# Altium project RheoBoard_v2.PrjPcb (part 4 of 5)
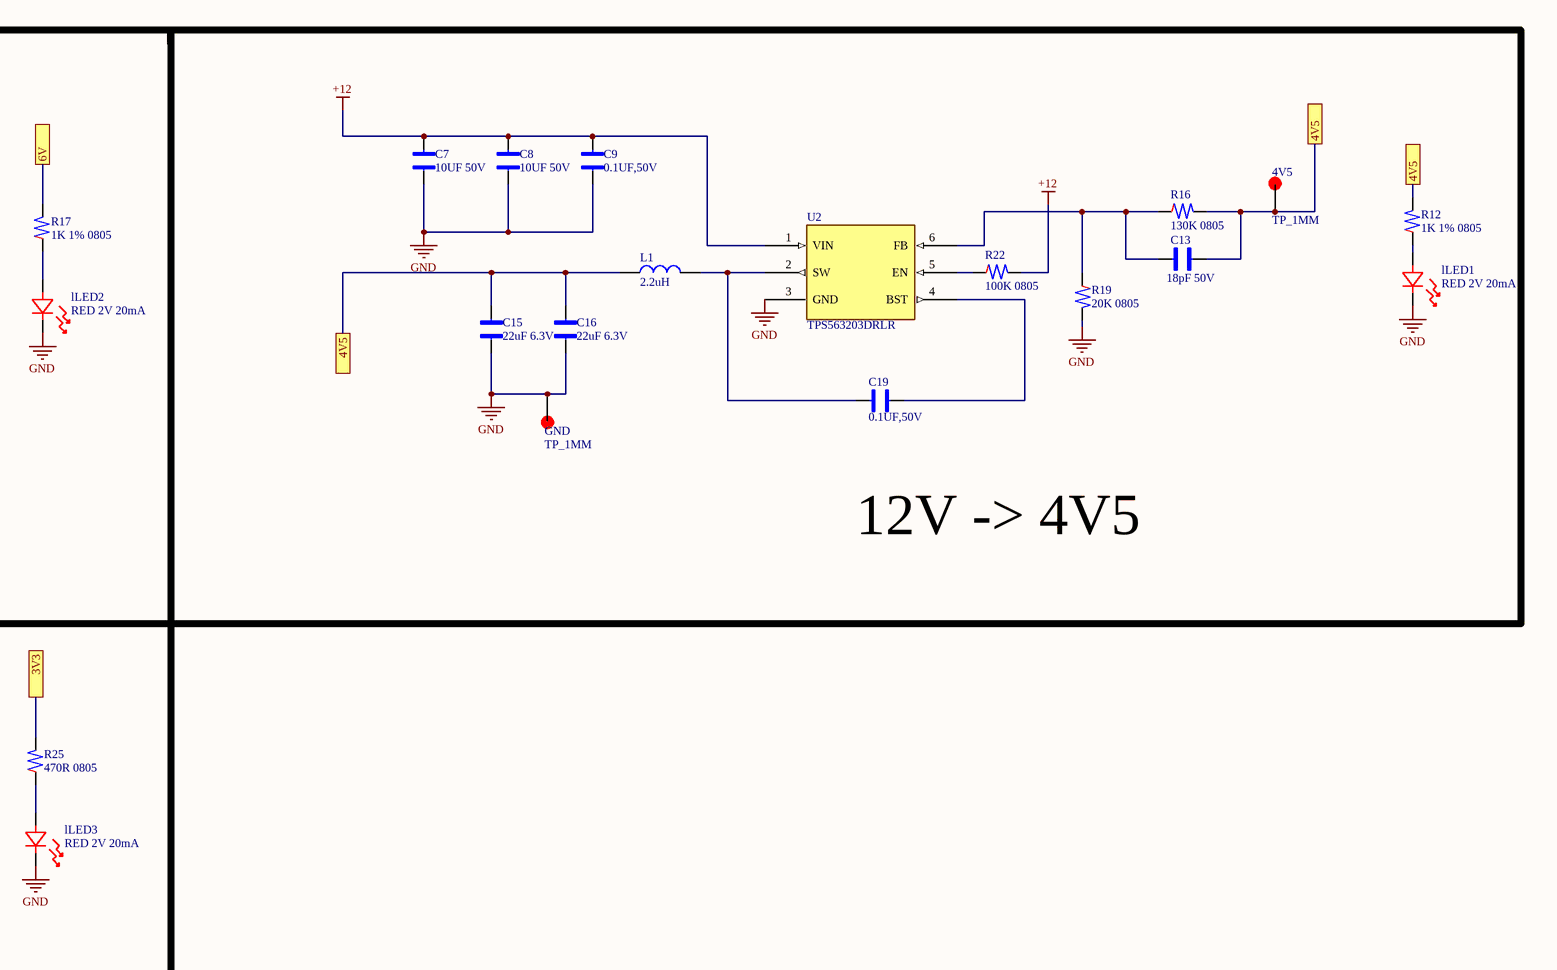
[diagram p13: POWER.SchDoc, right]

## Sheet POWER.SchDoc (continued)
### Library data of the parts
6V = TP_1MM
C7 C8 C10 C11 = CAP_CER, 0805, X5R, 10UF, 10%, 50V: CAP_CER,0805,X5R,10UF,10%,50V; Manufacturer: Nextgen; Manufacturer Part Number: 0805W106K500CC; LIB MADE BY: MR HOANG; Supplier 1: DigiKey Marketplace; Category: Ceramic Capacitors; Stock 1: 8000000; Pricing 1: 3000=1.1378 (USD); LINK: https://linhkien.cxtvn.com/1978-tu-106-10uf-0805-50v-10-10c.html; Supplier Part Number 1: 3372-0805W106K500CCTR-ND
C9 C12 C19-C22 = CAP_CER, 0805, X7R, 0.1UF, 5%, 50V: Ceramic Capacitor, Multilayer, Ceramic, 50V, 10% +Tol, 10% -Tol, X7R, 15% TC, 0.1uF, Surface Mount, 0805; Manufacturer: Nextgen; Manufacturer Part Number: 0805B104K500BD; Capacitance: 100nF; LIB MADE BY: MR HOANG; Supplier 1: DigiKey Marketplace; RoHS: Compliant; Category: Ceramic Capacitors; Stock 1: 24000; Pricing 1: 8000=0.0788 (USD); Dielectric Material: Ceramic; Export Control Classification Number (ECCN) Code: EAR99; Height: 850µm; Harmonized Tariff Schedule (HTS) Code: 8532.24.00.20; Length: 2mm; Max Operating Temperature: 125°C; Min Operating Temperature: -55°C; Mount: Surface Mount; Number of Terminals: 2; REACH SVHC: Yes; Voltage Rating (DC): 50V; Width: 1.25mm; ComponentLink1Description: New link; ComponentLink1URL: *; LINK: https://linhkien.cxtvn.com/1976-tu-khong-phan-cuc-0805.html; Supplier Part Number 1: 3372-0805B104K500BDTR-ND
C13 C14 = CAP_CER, 18PF 50V X8R 0805: Multilayer Ceramic Capacitors MLCC - SMD/SMT 50V 18pF X8R 0805 5%; Manufacturer: Yageo Group; Manufacturer Part Number: C0805C180J5HACTU; Temperature Coefficient: 30ppm/°C; LIB MADE BY: MR HOANG; Supplier 1: DigiKey; RoHS: Compliant; Category: Ceramic Capacitors; Stock 1: 17375; Pricing 1: 1=0.1, 10=0.054, 50=0.0372, 100=0.0321, 500=0.02342, 1000=0.02077 (USD); Capacitance: 18pF; Case/Package: 0805; China RoHS: Compliant; Country of Origin: Mexico; Dielectric: X8R; Dielectric Material: Ceramic; Export Control Classification Number (ECCN) Code: EAR99; Height: 780µm; Harmonized Tariff Schedule (HTS) Code: 8532.24.00.20; Introduction Date: 2017-10-02; Lead Free: Lead Free; Length: 2mm; Lifecycle Status: Production; Material: Ceramic; Max Operating Temperature: 150°C; Min Operating Temperature: -55°C; Mount: Surface Mount; Number of Terminals: 2; REACH SVHC: Yes; Voltage Rating: 50V; Voltage Rating (DC): 50V; Width: 1.25mm; ComponentLink1URL: https://datasheet.octopart.com:443/C0805C180J5HACTU-KEMET-datasheet-178087918.pdf?src-supplier=IHS; ComponentLink1Description: https://datasheet.octopart.com:443/C0805C180J5HACTU-KEMET-datasheet-178087918.pdf?src-supplier=IHS; ComponentLink2URL: https://datasheet.octopart.com:443/C0805C180J5HACTU-KEMET-datasheet-68331921.pdf?src-supplier=Upverter; ComponentLink2Description: https://datasheet.octopart.com:443/C0805C180J5HACTU-KEMET-datasheet-68331921.pdf?src-supplier=Upverter; ComponentLink3URL: https://datasheet.octopart.com:443/C0805C180J5HACTU-KEMET-datasheet-189885856.pdf?src-supplier=element14+APAC; ComponentLink3Description: https://datasheet.octopart.com:443/C0805C180J5HACTU-KEMET-datasheet-189885856.pdf?src-supplier=element14+APAC; ComponentLink4URL: https://datasheet.octopart.com/C0805C180J5HACTU-KEMET-datasheet-84169754.pdf; ComponentLink4Description: https://datasheet.octopart.com/C0805C180J5HACTU-KEMET-datasheet-84169754.pdf; Supplier Part Number 1: 399-C0805C180J5HACTUCT-ND; LINK: https://linhkien.cxtvn.com/2648-tu-180-18pf-0805-50v-5-20c.html
C15-C18 C25 C26 = CAP_CER 22UF 6.3V X6S 0603: 6.3V 22uF X6S ±20% 0603 Multilayer Ceramic Capacitors MLCC - SMD/SMT ROHS; Manufacturer: Murata; Manufacturer Part Number: GRM188C80J226ME15D; Manufacturer Lifecycle Status: IN PRODUCTION; Capacitance: 22µF; LIB MADE BY: MR HOANG; Supplier 1: DigiKey; RoHS: Compliant; Category: Ceramic Capacitors; Stock 1: 368335; Pricing 1: 1=0.18, 10=0.104, 50=0.0732, 100=0.0639, 500=0.04836, 1000=0.04357 (USD); Case/Package: 0603; Case Code (Imperial): 0603; Case Code (Metric): 1608; Country of Origin: Japan, Mainland China, Philippines, Singapore, Thailand; Dielectric: X6S; Dielectric Material: Ceramic; Export Control Classification Number (ECCN) Code: EAR99; Height: 800µm; Harmonized Tariff Schedule (HTS) Code: 8532.24.00.20; Introduction Date: 2013-11-20; Lead Free: Lead Free; Length: 1.6mm; Lifecycle Status: Production; Material: Ceramic; Max Operating Temperature: 105°C; Min Operating Temperature: -55°C; Mount: Surface Mount; Number of Terminals: 2; Packaging: Tape & Reel (TR); REACH SVHC: Yes; Schedule B: 8532240020, 8532240020|8532240020|8532240020|8532240020|8532240020|8532240020|8532240020|8532240020|8532240020|8532240020|8532240020|8532240020|8532240020|8532240020|8532240020|8532240020|8532240020|8532240020|8532240020|8532240020|8532240020|8532240020|8532240020|85; Termination: SMD/SMT; Thickness: 800µm; Tolerance: 20%; Voltage Rating: 6.3V; Voltage Rating (DC): 6.3V; Weight: 6.293594mg; Width: 800µm; ComponentLink1URL: https://datasheet.octopart.com:443/GRM188C80J226ME15D-Murata-datasheet-149523170.pdf?src-supplier=Newark; ComponentLink1Description: https://datasheet.octopart.com:443/GRM188C80J226ME15D-Murata-datasheet-149523170.pdf?src-supplier=Newark; ComponentLink2URL: https://datasheet.octopart.com:443/GRM188C80J226ME15D-Murata-datasheet-141274635.pdf?src-supplier=Geoflip; ComponentLink2Description: https://datasheet.octopart.com:443/GRM188C80J226ME15D-Murata-datasheet-141274635.pdf?src-supplier=Geoflip; ComponentLink3URL: https://datasheet.octopart.com:443/GRM188C80J226ME15D-Murata-datasheet-165579666.pdf?src-supplier=TME; ComponentLink3Description: https://datasheet.octopart.com:443/GRM188C80J226ME15D-Murata-datasheet-165579666.pdf?src-supplier=TME; ComponentLink4URL: https://datasheet.octopart.com:443/GRM188C80J226ME15D-Murata-datasheet-140703315.pdf?src-supplier=Ciiva; ComponentLink4Description: https://datasheet.octopart.com:443/GRM188C80J226ME15D-Murata-datasheet-140703315.pdf?src-supplier=Ciiva; ComponentLink5URL: https://datasheet.octopart.com:443/GRM188C80J226ME15D-Murata-datasheet-138742657.pdf?src-supplier=Ciiva; ComponentLink5Description: https://datasheet.octopart.com:443/GRM188C80J226ME15D-Murata-datasheet-138742657.pdf?src-supplier=Ciiva; ComponentLink6URL: https://datasheet.octopart.com:443/GRM188C80J226ME15D-Murata-datasheet-22122223.pdf?src-supplier=Future+Electronics; ComponentLink6Description: https://datasheet.octopart.com:443/GRM188C80J226ME15D-Murata-datasheet-22122223.pdf?src-supplier=Future+Electronics; ComponentLink7URL: https://datasheet.octopart.com/GRM188C80J226ME15D-Murata-datasheet-12515295.pdf; ComponentLink7Description: https://datasheet.octopart.com/GRM188C80J226ME15D-Murata-datasheet-12515295.pdf; ComponentLink8URL: https://datasheet.octopart.com/GRM188C80J226ME15D-Murata-datasheet-12510076.pdf; ComponentLink8Description: https://datasheet.octopart.com/GRM188C80J226ME15D-Murata-datasheet-12510076.pdf; ComponentLink9URL: https://datasheet.octopart.com/GRM188C80J226ME15D-Murata-datasheet-11978611.pdf; ComponentLink9Description: https://datasheet.octopart.com/GRM188C80J226ME15D-Murata-datasheet-11978611.pdf; ComponentLink10URL: https://datasheet.octopart.com/GRM188C80J226ME15D-Murata-datasheet-10025737.pdf; ComponentLink10Description: https://datasheet.octopart.com/GRM188C80J226ME15D-Murata-datasheet-10025737.pdf; ComponentLink11URL: https://datasheet.octopart.com/GRM188C80J226ME15D-Murata-datasheet-8819587.pdf; ComponentLink11Description: https://datasheet.octopart.com/GRM188C80J226ME15D-Murata-datasheet-8819587.pdf; ComponentLink12URL: https://datasheet.octopart.com:443/GRM188C80J226ME15D-Murata-datasheet-150839322.pdf?src-supplier=Arrow.cn; ComponentLink12Description: https://datasheet.octopart.com:443/GRM188C80J226ME15D-Murata-datasheet-150839322.pdf?src-supplier=Arrow.cn; ComponentLink13URL: http://sigma.octopart.com:80/reach_statement/Murata-company-16.pdf?src-supplier=Compliance+Statements; ComponentLink13Description: http://sigma.octopart.com:80/reach_statement/Murata-company-16.pdf?src-supplier=Compliance+Statements; Supplier Part Number 1: 490-10471-1-ND; LINK: https://linhkien.cxtvn.com/3837-tu-226-22uf-0603-63v-20c.html
C23 C24 = CAP_CER, 0805, X5R, 10UF, 10%, 25V: Cap SMD, 0805, X5R, 10UF, 10%, 25V; Manufacturer: Nextgen; Manufacturer Part Number: 0805W106K250CC; LIB MADE BY: MR HOANG; Supplier 1: DigiKey Marketplace; Category: Ceramic Capacitors; Stock 1: 18000; Pricing 1: 6000=0.1738 (USD); Supplier Part Number 1: 3372-0805W106K250CCTR-ND; LINK: https://linhkien.cxtvn.com/5144-tu-10uf-0805-25v-10-10c.html
D8 = MOSFET P-CH 20V 4A SOT23-3: P-ch Mosfet 20V 4A 39MΩ@4A, 4.5V 9.1NC@4.5V 294PF@10V SOT-23-3 SMD 2.9MM × 1.3MM × 1.03MM; Manufacturer: Diodes Inc.; Manufacturer Part Number: DMG3415U-7; Drain to Source Breakdown Voltage: -20V; Drain to Source Resistance: 42.5mΩ; Element Configuration: Single; Fall Time: 393ns; Gate to Source Voltage (Vgs): 8V; Input Capacitance: 294pF; Max Junction Temperature (Tj): 150°C; Max Power Dissipation: 900mW; Nominal Vgs: -550mV; Number of Channels: 1; Rds On Max: 39mΩ; Rise Time: 117ns; Turn-Off Delay Time: 795ns; Turn-On Delay Time: 71ns; LIB MADE BY: MR HOANG; Supplier 1: DigiKey; RoHS: Compliant; Category: MOSFETs; Stock 1: 74827; Pricing 1: 1=0.52, 10=0.318, 25=0.264, 50=0.23, 100=0.2012 (USD); Case/Package: SOT-23; China RoHS: Compliant; Contact Plating: Tin; Continuous Drain Current (ID): 4A; Drain to Source Voltage (Vdss): -20V; Height: 1.1mm; Lead Free: Lead Free; Length: 2.9mm; Lifecycle Status: NRND; Max Operating Temperature: 150°C; Min Breakdown Voltage: 20V; Min Operating Temperature: -55°C; Mount: Surface Mount; Number of Elements: 1; Number of Pins: 3; Number of Terminals: 3; Packaging: Cut Tape; Power Dissipation: 900mW; Radiation Hardening: No; REACH SVHC: Yes; Resistance: 42.5mΩ; Schedule B: 8541210080, 8541210080|8541210080|8541210080|8541210080|8541210080|8541210080|8541210080|8541210080|8541210080|8541210080|8541210080|8541210080|8541210080|8541210080|8541210080|8541210080|8541210080|8541210080|8541210080|8541210080|8541210080|8541210080|8541210080|85; Threshold Voltage: -550mV; Weight: 7.994566mg; Width: 1.3mm; ComponentLink1URL: https://datasheet.octopart.com:443/DMG3415U-7-Diodes-Inc.-datasheet-180552899.pdf?src-supplier=IHS; ComponentLink1Description: https://datasheet.octopart.com:443/DMG3415U-7-Diodes-Inc.-datasheet-180552899.pdf?src-supplier=IHS; ComponentLink2URL: https://datasheet.octopart.com:443/DMG3415U-7-Diodes-Inc.-datasheet-41567333.pdf?src-supplier=Newark; ComponentLink2Description: https://datasheet.octopart.com:443/DMG3415U-7-Diodes-Inc.-datasheet-41567333.pdf?src-supplier=Newark; ComponentLink3URL: https://datasheet.octopart.com:443/DMG3415U-7-Diodes-Inc.-datasheet-12530588.pdf?src-supplier=Newark; ComponentLink3Description: https://datasheet.octopart.com:443/DMG3415U-7-Diodes-Inc.-datasheet-12530588.pdf?src-supplier=Newark; ComponentLink4URL: https://datasheet.octopart.com:443/DMG3415U-7-Diodes-Inc.-datasheet-10027536.pdf?src-supplier=Newark; ComponentLink4Description: https://datasheet.octopart.com:443/DMG3415U-7-Diodes-Inc.-datasheet-10027536.pdf?src-supplier=Newark; ComponentLink5URL: https://sigma.octopart.com:443/138706058/technical_drawing/Diodes-Inc.-DMG3415U-7.pdf?src-supplier=Upverter; ComponentLink5Description: https://sigma.octopart.com:443/138706058/technical_drawing/Diodes-Inc.-DMG3415U-7.pdf?src-supplier=Upverter; ComponentLink6URL: https://datasheet.octopart.com:443/DMG3415U-7-Diodes-Inc.-datasheet-14060167.pdf?src-supplier=iiiC; ComponentLink6Description: https://datasheet.octopart.com:443/DMG3415U-7-Diodes-Inc.-datasheet-14060167.pdf?src-supplier=iiiC; ComponentLink7URL: https://datasheet.octopart.com:443/DMG3415U-7-Diodes-Inc.-datasheet-11766085.pdf?src-supplier=Future+Electronics; ComponentLink7Description: https://datasheet.octopart.com:443/DMG3415U-7-Diodes-Inc.-datasheet-11766085.pdf?src-supplier=Future+Electronics; ComponentLink8URL: http://sigma.octopart.com:80/15540767/rohs_statement/Diodes-Inc.-DMG3415U-7.pdf?src-supplier=Compliance+Statements; ComponentLink8Description: http://sigma.octopart.com:80/15540767/rohs_statement/Diodes-Inc.-DMG3415U-7.pdf?src-supplier=Compliance+Statements; Supplier Part Number 1: DMG3415UDIDKR-ND; LINK: https://linhkien.cxtvn.com/2362-dmg3415-mosfet-p-ch-20v-4a-sot23-3-5c.html
D9 = DIODE ZENER 5.1V 500MW SOD123F: BZT52C5V1 Series 500 mW 5.1 V 10 mA Surface Mount Zener Diode - SOD-123; Manufacturer: Diodes Inc.; Manufacturer Part Number: BZT52C5V1-7-F; Current: 1A; Element Configuration: Single; Forward Current: 10mA; Forward Voltage: 900mV; Impedance: 60Ω; Max Junction Temperature (Tj): 150°C; Max Power Dissipation: 370mW; Max Reverse Leakage Current: 2µA; Number of Elements: 1; Output Current: 50mA; Polarity: Unidirectional; Power Rating: 500mW; Reference Voltage: 5.1V; Reverse Standoff Voltage: 2V; Test Current: 5mA; Tolerance: 6%; Voltage Tolerance: 5.88%; LIB MADE BY: MR HOANG; Supplier 1: DigiKey; RoHS: Compliant; Category: Zener Diodes; Pricing 1: 1=0.21, 10=0.128, 25=0.1052, 50=0.091, 100=0.079 (USD); China RoHS: Compliant; Composition: Zener; Country of Origin: Mainland China, Taiwan; Export Control Classification Number (ECCN) Code: EAR99; Height: 1.45mm; Harmonized Tariff Schedule (HTS) Code: 8541.10.00.50; Introduction Date: 2002-09-04; Lead Free: Lead Free; Length: 2.85mm; Lifecycle Status: Production; Max Operating Temperature: 150°C; Min Operating Temperature: -65°C; Mount: Surface Mount; Number of Pins: 2; Number of Terminals: 2; Packaging: Cut Tape; Peak Reverse Current: 2µA; Power Dissipation: 370mW; Radiation Hardening: No; REACH SVHC: Yes; Schedule B: 8541100050, 8541100050|8541100050|8541100050|8541100050|8541100050|8541100050|8541100050|8541100050|8541100050|8541100050|8541100050|8541100050|8541100050|8541100050|8541100050|8541100050|8541100050|8541100050|8541100050|8541100050|8541100050|8541100050|8541100050|85; Termination: SMD/SMT; Voltage Rating (DC): 5.1V; Weight: 10.007382mg; Width: 1.7mm; Working Voltage: 5.1V; Zener Current: 5mA; Zener Voltage: 5.1V; ComponentLink1URL: https://datasheet.octopart.com:443/BZT52C5V1-7-F-Diodes-Inc.-datasheet-101585693.pdf?src-supplier=IHS; ComponentLink1Description: https://datasheet.octopart.com:443/BZT52C5V1-7-F-Diodes-Inc.-datasheet-101585693.pdf?src-supplier=IHS; ComponentLink2URL: https://sigma.octopart.com:443/138895985/technical_drawing/Diodes-Inc.-BZT52C5V1-7-F.pdf?src-supplier=Diodes+Inc+SCT; ComponentLink2Description: https://sigma.octopart.com:443/138895985/technical_drawing/Diodes-Inc.-BZT52C5V1-7-F.pdf?src-supplier=Diodes+Inc+SCT; ComponentLink3URL: https://datasheet.octopart.com:443/BZT52C5V1-7-F-Diodes-Inc.-datasheet-12513818.pdf?src-supplier=Newark; ComponentLink3Description: https://datasheet.octopart.com:443/BZT52C5V1-7-F-Diodes-Inc.-datasheet-12513818.pdf?src-supplier=Newark; ComponentLink4URL: https://datasheet.octopart.com:443/BZT52C5V1-7-F-Diodes-Inc.-datasheet-10839781.pdf?src-supplier=element14+APAC; ComponentLink4Description: https://datasheet.octopart.com:443/BZT52C5V1-7-F-Diodes-Inc.-datasheet-10839781.pdf?src-supplier=element14+APAC; ComponentLink5URL: https://datasheet.octopart.com:443/BZT52C5V1-7-F-Diodes-Inc.-datasheet-10941054.pdf?src-supplier=element14+APAC; ComponentLink5Description: https://datasheet.octopart.com:443/BZT52C5V1-7-F-Diodes-Inc.-datasheet-10941054.pdf?src-supplier=element14+APAC; ComponentLink6URL: https://datasheet.octopart.com:443/BZT52C5V1-7-F-Diodes-Inc.-datasheet-10405015.pdf?src-supplier=element14+APAC; ComponentLink6Description: https://datasheet.octopart.com:443/BZT52C5V1-7-F-Diodes-Inc.-datasheet-10405015.pdf?src-supplier=element14+APAC; ComponentLink7URL: https://datasheet.octopart.com:443/BZT52C5V1-7-F-Diodes-Inc.-datasheet-5318325.pdf?src-supplier=element14+APAC; ComponentLink7Description: https://datasheet.octopart.com:443/BZT52C5V1-7-F-Diodes-Inc.-datasheet-5318325.pdf?src-supplier=element14+APAC; ComponentLink8URL: https://datasheet.octopart.com:443/BZT52C5V1-7-F-Diodes-Inc.-datasheet-14050928.pdf?src-supplier=iiiC; ComponentLink8Description: https://datasheet.octopart.com:443/BZT52C5V1-7-F-Diodes-Inc.-datasheet-14050928.pdf?src-supplier=iiiC; ComponentLink9URL: https://datasheet.octopart.com:443/BZT52C5V1-7-F-Diodes-Inc.-datasheet-7278440.pdf?src-supplier=Jameco+(USA); ComponentLink9Description: https://datasheet.octopart.com:443/BZT52C5V1-7-F-Diodes-Inc.-datasheet-7278440.pdf?src-supplier=Jameco+(USA); ComponentLink10URL: https://datasheet.octopart.com:443/BZT52C5V1-7-F-Diodes-Inc.-datasheet-1309.pdf?src-supplier=Mouser; ComponentLink10Description: https://datasheet.octopart.com:443/BZT52C5V1-7-F-Diodes-Inc.-datasheet-1309.pdf?src-supplier=Mouser; ComponentLink11URL: https://datasheet.octopart.com:443/BZT52C5V1-7-F-Diodes-Inc.-datasheet-593.pdf?src-supplier=DigiKey; ComponentLink11Description: https://datasheet.octopart.com:443/BZT52C5V1-7-F-Diodes-Inc.-datasheet-593.pdf?src-supplier=DigiKey; ComponentLink12URL: http://sigma.octopart.com:80/15616906/materials_sheet/Diodes-Inc.-BZT52C5V1-7-F.pdf?src-supplier=Compliance+Statements; ComponentLink12Description: http://sigma.octopart.com:80/15616906/materials_sheet/Diodes-Inc.-BZT52C5V1-7-F.pdf?src-supplier=Compliance+Statements; Supplier Part Number 1: BZT52C5V1-FDICT-ND; ComponentLink13Description: New link; ComponentLink13URL: *; LINK: https://linhkien.cxtvn.com/2446-bzt52c5v1-diode-zener-51v-500mw-sod123-10c.html
J6 = CONN PWR JACK 2.1X5.5MM SOLDER: DC Power Jack Connector WR-DC, Male, Right Angled, THT, 5 A, 24 V; Manufacturer: Wurth Elektronik; Manufacturer Lifecycle Status: ACTIVE; Current Rating: 5A; Insulation Resistance: 100MΩ; Number of Contacts: 3; Operating Supply Voltage: 24V; Shielding: Unshielded; YEOL: 1 = Estimated lifetime > 10 years; LIB MADE BY: MR HOANG; Supplier 1: DigiKey; Manufacturer Part Number: 694106301002; RoHS: Compliant; Category: Power Connectors; Stock 1: 29038; Pricing 1: 1=0.97, 10=0.922, 50=0.817, 100=0.76, 500=0.6555, 1000=0.59885 (USD); Color: Black; Connector Type: Power; Contact Gender: Female; Contact Material: Gold, Tin; Contact Plating: Tin; Flammability Rating: UL94 V-0; Gender: Male; Height: 11mm; Housing Material: Polyamide; Lifecycle Status: Production; Max Operating Temperature: 85°C; Min Operating Temperature: -40°C; Mount: Through Hole; Packaging: Bulk; REACH SVHC: Unknown; Termination: Through Hole; Voltage Rating: 24V; ComponentLink1URL: https://datasheet.octopart.com:443/694106301002-W%C3%BCrth-Elektronik-datasheet-111088219.pdf?src-supplier=Newark; ComponentLink1Description: https://datasheet.octopart.com:443/694106301002-W%C3%BCrth-Elektronik-datasheet-111088219.pdf?src-supplier=Newark; ComponentLink2URL: https://datasheet.octopart.com:443/694106301002-W%C3%BCrth-Elektronik-datasheet-38737356.pdf?src-supplier=Farnell; ComponentLink2Description: https://datasheet.octopart.com:443/694106301002-W%C3%BCrth-Elektronik-datasheet-38737356.pdf?src-supplier=Farnell; ComponentLink3URL: https://datasheet.octopart.com:443/694106301002-W%C3%BCrth-Elektronik-datasheet-66582004.pdf?src-supplier=Farnell; ComponentLink3Description: https://datasheet.octopart.com:443/694106301002-W%C3%BCrth-Elektronik-datasheet-66582004.pdf?src-supplier=Farnell; Supplier Part Number 1: 732-5930-ND; ComponentLink4Description: New link; ComponentLink4URL: *; LINK: https://www.lcsc.com/product-detail/C5184829.html?s_z=n_q_694106301002&spm=wm.fly.bg.0.xh&lcsc_vid=FlMMUgJST1FcAwECRwALVlxQQAdaX1xfRFUPAlJUQFExVlNeTlBWV1NVQllaUjsOAxUeFF5JWBYZEEoKFBINSQcJGk4NBhADEA4cHktXRlhXSQwSGg0%3D
L1 L2 = FIXED IND 2.2UH 3A 45 MOHM SMD: Inductor Power Shielded Wirewound 2.2uH 20% 100KHz Ferrite 3.1A 0.045Ohm DCR 1515 T/R; Manufacturer: Vishay; Manufacturer Part Number: IFSC1515AHER2R2M01; Current Rating: 3A; DC Resistance (DCR): 45mΩ; Inductance: 2.2µH; Max Current Rating: 2.8A; Number of Circuits: 1; Resistance: 35mΩ; LIB MADE BY: MR HOANG; Supplier 1: DigiKey; RoHS: Compliant; Category: Fixed Inductors; Stock 1: 112441; Pricing 1: 1=0.43, 10=0.35, 100=0.2878, 1000=0.23664 (USD); Case/Package: 1515; Composition: Wirewound; Contact Plating: Tin; Core Material: Ferrite; Country of Origin: Mainland China; Depth: 4mm; Export Control Classification Number (ECCN) Code: EAR99; Height: 1.8mm; Height - Seated (Max): 1.905mm; Harmonized Tariff Schedule (HTS) Code: 8504.50.80.00; Inductance Tolerance: 20%; Introduction Date: 2011-04-11; Lead Free: Lead Free; Length: 4mm; Lifecycle Status: Production; Max DC Current: 3A; Max Operating Temperature: 125°C; Military Standard: Not; Min Operating Temperature: -55°C; Mount: Surface Mount; Number of Pins: 2; Number of Terminals: 2; REACH SVHC: Yes; RMS Current (Irms): 3.1A; Saturation Current: 2.8A; Schedule B: 8504500000, 8504500000|8504500000|8504500000|8504500000|8504500000; Series Resistance: 45mΩ; Shielding: Shielded; Termination: SMD/SMT; Test Frequency: 100kHz; Tolerance: 20%; Width: 4mm; ComponentLink1URL: https://datasheet.octopart.com:443/IFSC1515AHER2R2M01-Vishay-datasheet-136687317.pdf?src-supplier=Newark; ComponentLink1Description: https://datasheet.octopart.com:443/IFSC1515AHER2R2M01-Vishay-datasheet-136687317.pdf?src-supplier=Newark; ComponentLink2URL: https://datasheet.octopart.com:443/IFSC1515AHER2R2M01-Vishay-datasheet-13160403.pdf?src-supplier=Newark; ComponentLink2Description: https://datasheet.octopart.com:443/IFSC1515AHER2R2M01-Vishay-datasheet-13160403.pdf?src-supplier=Newark; ComponentLink3URL: https://datasheet.octopart.com:443/IFSC1515AHER2R2M01-Vishay-datasheet-13060574.pdf?src-supplier=Newark; ComponentLink3Description: https://datasheet.octopart.com:443/IFSC1515AHER2R2M01-Vishay-datasheet-13060574.pdf?src-supplier=Newark; ComponentLink4URL: https://datasheet.octopart.com:443/IFSC1515AHER2R2M01-Vishay-datasheet-41303275.pdf?src-supplier=Newark; ComponentLink4Description: https://datasheet.octopart.com:443/IFSC1515AHER2R2M01-Vishay-datasheet-41303275.pdf?src-supplier=Newark; ComponentLink5URL: https://datasheet.octopart.com:443/IFSC1515AHER2R2M01-Vishay-datasheet-79543287.pdf?src-supplier=Upverter; ComponentLink5Description: https://datasheet.octopart.com:443/IFSC1515AHER2R2M01-Vishay-datasheet-79543287.pdf?src-supplier=Upverter; ComponentLink6URL: https://datasheet.octopart.com:443/IFSC1515AHER2R2M01-Vishay-datasheet-193387337.pdf?src-supplier=JRH+Electronics; ComponentLink6Description: https://datasheet.octopart.com:443/IFSC1515AHER2R2M01-Vishay-datasheet-193387337.pdf?src-supplier=JRH+Electronics; ComponentLink7URL: https://datasheet.octopart.com:443/IFSC1515AHER2R2M01-Vishay-datasheet-66100361.pdf?src-supplier=Farnell; ComponentLink7Description: https://datasheet.octopart.com:443/IFSC1515AHER2R2M01-Vishay-datasheet-66100361.pdf?src-supplier=Farnell; ComponentLink8URL: https://datasheet.octopart.com:443/IFSC1515AHER2R2M01-Vishay-datasheet-17360805.pdf?src-supplier=Farnell; ComponentLink8Description: https://datasheet.octopart.com:443/IFSC1515AHER2R2M01-Vishay-datasheet-17360805.pdf?src-supplier=Farnell; ComponentLink9URL: https://datasheet.octopart.com:443/IFSC1515AHER2R2M01-Vishay-datasheet-41195463.pdf?src-supplier=Farnell; ComponentLink9Description: https://datasheet.octopart.com:443/IFSC1515AHER2R2M01-Vishay-datasheet-41195463.pdf?src-supplier=Farnell; ComponentLink10URL: https://datasheet.octopart.com:443/IFSC1515AHER2R2M01-Vishay-datasheet-62318043.pdf?src-supplier=element14+APAC; ComponentLink10Description: https://datasheet.octopart.com:443/IFSC1515AHER2R2M01-Vishay-datasheet-62318043.pdf?src-supplier=element14+APAC; ComponentLink11URL: https://datasheet.octopart.com:443/IFSC1515AHER2R2M01-Vishay-Dale-datasheet-41169526.pdf?src-supplier=element14+APAC; ComponentLink11Description: https://datasheet.octopart.com:443/IFSC1515AHER2R2M01-Vishay-Dale-datasheet-41169526.pdf?src-supplier=element14+APAC; ComponentLink12URL: http://sigma.octopart.com:80/rohs_statement/Vishay-company-15.pdf?src-supplier=Compliance+Statements; ComponentLink12Description: http://sigma.octopart.com:80/rohs_statement/Vishay-company-15.pdf?src-supplier=Compliance+Statements; Supplier Part Number 1: 541-1404-6-ND; LINK: https://linhkien.cxtvn.com/10174-cuon-cam-22uh-cd127-3a-12x12x7mm.html
L3 = FIXED IND 4.7UH 6.3A 33 MOHM SMD: FIXED IND 4.7UH 6.3A 33MOHM SMD / 4.7 µH Shielded Molded Inductor 6.3 A 33mOhm Max Nonstandard; Manufacturer: Sumida; Manufacturer Part Number: 0630CDMCCDS-4R7MC; Core Material: Metal; DC Resistance (DCR): 33mΩ; Inductance: 4.7µH; Number of Circuits: 1; Saturation Current: 6.8A; Test Frequency: 100kHz; Tolerance: 20%; Supplier 1: DigiKey; RoHS: Compliant; Category: Fixed Inductors; Stock 1: 7042; Pricing 1: 1=0.75, 10=0.617, 100=0.5073 (USD); Case/Package: 2826; Current Rating: 6.3A; Export Control Classification Number (ECCN) Code: EAR99; Height: 2.8mm; Height - Seated (Max): 2.9972mm; Harmonized Tariff Schedule (HTS) Code: 8504.50.80.00; Introduction Date: 2015-07-17; Length: 7mm; Lifecycle Status: Production; Max Current Rating: 6.3A; Max DC Current: 6.3A; Max Operating Temperature: 125°C; Min Operating Temperature: -55°C; Mount: Surface Mount; Number of Terminals: 2; Shielding: Shielded; Width: 6.6mm; ComponentLink1URL: https://datasheet.octopart.com:443/0630CDMCCDS-4R7MC-Sumida-datasheet-181250631.pdf?src-supplier=IHS; ComponentLink1Description: https://datasheet.octopart.com:443/0630CDMCCDS-4R7MC-Sumida-datasheet-181250631.pdf?src-supplier=IHS; ComponentLink2URL: https://datasheet.octopart.com:443/0630CDMCCDS-4R7MC-Sumida-datasheet-111957342.pdf?src-supplier=Future+Electronics; ComponentLink2Description: https://datasheet.octopart.com:443/0630CDMCCDS-4R7MC-Sumida-datasheet-111957342.pdf?src-supplier=Future+Electronics; Supplier Part Number 1: 308-2466-1-ND
lLED1-lLED3 = LED RED DIFFUSED 0805 SMD: Red 633nm LED Indication - Discrete 2V 0805 (2012 Metric); Manufacturer: Osram; Manufacturer Part Number: LS R976-NR-1-0-20-R18; LIB MADE BY: MR HOANG; Supplier 1: DigiKey; Category: LEDs; Stock 1: 254416; Pricing 1: 1=0.15, 10=0.102, 100=0.0704, 500=0.05582, 1000=0.05095, 2000=0.04679 (USD); Schedule B: 8541402000, 8541402000|8541402000, 8541402000|8541402000|8541402000, 8541402000|8541402000|8541402000|8541402000; Supplier Part Number 1: 475-LSR976-NR-1CT-ND; Link: https://linhkien.cxtvn.com/10106-17-21surcs530-a3tr8-led-red-0805-624nm-10c.html
R12 R17 = RES_SMD 1K 1% 1/8W 0805: Yageo RC0805FR-071KL SMD Resistor 0603 1k Ohm ±1% Thick Film; Manufacturer: Yageo Group; Max Power Dissipation: 125mW; Resistance: 1kΩ; Temperature Coefficient: 100ppm/°C; Voltage Rating: 150V; LIBRARY MADE BY: Mr. HOANG; Supplier 1: element14 APAC; Manufacturer Part Number: RC0805FR-071KL; RoHS: Compliant; Category: Chip SMD Resistors; Stock 1: 210000; Pricing 1: 5000=0.012, 25000=0.010, 50000=50000 (USD); Case/Package: 0805; Case Code (Imperial): 0805; China RoHS: Non-Compliant; Composition: Thick Film; Country of Origin: Mainland China, Taiwan; Depth: 1.25mm; Export Control Classification Number (ECCN) Code: EAR99; Features: Moisture Resistant; Height: 500µm; Harmonized Tariff Schedule (HTS) Code: 8533.21.00.30; Introduction Date: 2004-09-22; Lead Free: Lead Free; Length: 2mm; Lifecycle Status: Production; Max Operating Temperature: 155°C; Military Standard: Not; Min Operating Temperature: -55°C; Mount: Surface Mount; Number of Pins: 2; Number of Terminals: 2; Number of Terminations: 2; Packaging: Tape & Reel; Power Dissipation: 125mW; Power Rating: 125mW; REACH SVHC: Yes; Schedule B: 8533210045, 8533210045|8533210045, 8533210045|8533210045|8533210045, 8533210045|8533210045|8533210045|8533210045; Termination: SMD/SMT; Tolerance: 1%; Voltage Rating (AC): 150V; Voltage Rating (DC): 150V; Width: 1.25mm; Working Voltage: 150V; ComponentLink1URL: https://datasheet.octopart.com:443/RC0805FR-071KL-Yageo-datasheet-175887523.pdf?src-supplier=IHS; ComponentLink1Description: https://datasheet.octopart.com:443/RC0805FR-071KL-Yageo-datasheet-175887523.pdf?src-supplier=IHS; ComponentLink2URL: https://datasheet.octopart.com:443/RC0805FR-071KL-Yageo-datasheet-103092701.pdf?src-supplier=Upverter; ComponentLink2Description: https://datasheet.octopart.com:443/RC0805FR-071KL-Yageo-datasheet-103092701.pdf?src-supplier=Upverter; ComponentLink3URL: https://datasheet.octopart.com:443/RC0805FR-071KL-Yageo-datasheet-8330313.pdf?src-supplier=element14+APAC; ComponentLink3Description: https://datasheet.octopart.com:443/RC0805FR-071KL-Yageo-datasheet-8330313.pdf?src-supplier=element14+APAC; ComponentLink4URL: https://datasheet.octopart.com:443/RC0805FR-071KL-Yageo-datasheet-62067350.pdf?src-supplier=element14+APAC; ComponentLink4Description: https://datasheet.octopart.com:443/RC0805FR-071KL-Yageo-datasheet-62067350.pdf?src-supplier=element14+APAC; ComponentLink5URL: https://datasheet.octopart.com:443/RC0805FR-071KL-Yageo-datasheet-12592811.pdf?src-supplier=element14+APAC; ComponentLink5Description: https://datasheet.octopart.com:443/RC0805FR-071KL-Yageo-datasheet-12592811.pdf?src-supplier=element14+APAC; ComponentLink6URL: https://datasheet.octopart.com:443/RC0805FR-071KL-Yageo-Group-datasheet-190305687.pdf?src-supplier=Newark; ComponentLink6Description: https://datasheet.octopart.com:443/RC0805FR-071KL-Yageo-Group-datasheet-190305687.pdf?src-supplier=Newark; ComponentLink7URL: https://datasheet.octopart.com:443/RC0805FR-071KL-Yageo-Group-datasheet-176638170.pdf?src-supplier=Future+Electronics; ComponentLink7Description: https://datasheet.octopart.com:443/RC0805FR-071KL-Yageo-Group-datasheet-176638170.pdf?src-supplier=Future+Electronics; ComponentLink8URL: https://datasheet.octopart.com:443/RC0805FR-071KL-Yageo-datasheet-164759695.pdf?src-supplier=Future+Electronics; ComponentLink8Description: https://datasheet.octopart.com:443/RC0805FR-071KL-Yageo-datasheet-164759695.pdf?src-supplier=Future+Electronics; ComponentLink9URL: https://datasheet.octopart.com:443/RC0805FR-071KL-Yageo-datasheet-8324252.pdf?src-supplier=Future+Electronics; ComponentLink9Description: https://datasheet.octopart.com:443/RC0805FR-071KL-Yageo-datasheet-8324252.pdf?src-supplier=Future+Electronics; ComponentLink10URL: https://datasheet.octopart.com:443/RC0805FR-071KL-Yageo-datasheet-79472498.pdf?src-supplier=Megastar; ComponentLink10Description: https://datasheet.octopart.com:443/RC0805FR-071KL-Yageo-datasheet-79472498.pdf?src-supplier=Megastar; ComponentLink11URL: https://datasheet.octopart.com/RC0805FR-071KL-Yageo-datasheet-73766026.pdf; ComponentLink11Description: https://datasheet.octopart.com/RC0805FR-071KL-Yageo-datasheet-73766026.pdf; ComponentLink12URL: https://datasheet.octopart.com:443/RC0805FR-071KL-Yageo-datasheet-13691069.pdf?src-supplier=Farnell; ComponentLink12Description: https://datasheet.octopart.com:443/RC0805FR-071KL-Yageo-datasheet-13691069.pdf?src-supplier=Farnell; ComponentLink13URL: https://datasheet.octopart.com:443/RC0805FR-071KL-Yageo-datasheet-118657.pdf?src-supplier=DigiKey; ComponentLink13Description: https://datasheet.octopart.com:443/RC0805FR-071KL-Yageo-datasheet-118657.pdf?src-supplier=DigiKey; ComponentLink14URL: https://datasheet.octopart.com:443/RC0805FR-071KL-Yageo-datasheet-502840.pdf?src-supplier=element14; ComponentLink14Description: https://datasheet.octopart.com:443/RC0805FR-071KL-Yageo-datasheet-502840.pdf?src-supplier=element14; ComponentLink15URL: http://sigma.octopart.com:80/conflict_mineral_statement/Yageo-company-3.pdf?src-supplier=Compliance+Statements; ComponentLink15Description: http://sigma.octopart.com:80/conflict_mineral_statement/Yageo-company-3.pdf?src-supplier=Compliance+Statements; ComponentLink16URL: http://sigma.octopart.com:80/rohs_statement/Yageo-company-2.pdf?src-supplier=Compliance+Statements; ComponentLink16Description: http://sigma.octopart.com:80/rohs_statement/Yageo-company-2.pdf?src-supplier=Compliance+Statements; Supplier Part Number 1: 2421935; Link Viet Nam: https://linhkien.cxtvn.com/2346-dien-tro-1k-0805-1-50c.html; Link Cross: https://www.linhkienchatluong.vn/urlloai-0805-sai-so-1/dien-tro-dan-0805-1k-1-50-chiec_sp1569_ct5346.aspx; Parameter 4: *
R16 = RES_SMD 130K OHM 1% 1/8W 0805: Res Thick Film 0805 130K Ohm 1% 0.125W(1/8W) ±100ppm/C Pad SMD T/R; Manufacturer: Yageo Group; Manufacturer Part Number: RC0805FR-07130KL; Max Power Dissipation: 125mW; Resistance: 130kΩ; Temperature Coefficient: 100ppm/°C; Voltage Rating: 150V; LIB MADE BY: MR HOANG; Supplier 1: DigiKey; RoHS: Compliant; Category: Chip SMD Resistors; Stock 1: 49537; Pricing 1: 1=0.1, 10=0.034, 25=0.0256, 50=0.0208, 100=0.0171, 250=0.01344, 500=0.01136, 1000=0.00973 (USD); Case/Package: 0805; Case Code (Imperial): 0805; China RoHS: Non-Compliant; Composition: Thick Film; Depth: 1.25mm; Features: Moisture Resistant; Height: 500µm; Lead Free: Lead Free; Length: 2mm; Lifecycle Status: Production; Max Operating Temperature: 155°C; Military Standard: Not; Min Operating Temperature: -55°C; Mount: Surface Mount; Number of Terminals: 2; Number of Terminations: 2; Packaging: Tape & Reel; Power Rating: 125mW; REACH SVHC: Unaffected; Schedule B: 8533210045, 8533210045|8533210045|8533210045|8533210045|8533210045; Termination: SMD/SMT; Tolerance: 1%; Width: 1.25mm; Working Voltage: 150V; ComponentLink1URL: https://datasheet.octopart.com:443/RC0805FR-07130KL-Yageo-datasheet-175887523.pdf?src-supplier=Newark; ComponentLink1Description: https://datasheet.octopart.com:443/RC0805FR-07130KL-Yageo-datasheet-175887523.pdf?src-supplier=Newark; ComponentLink2URL: https://datasheet.octopart.com:443/RC0805FR-07130KL-Yageo-datasheet-103092701.pdf?src-supplier=Upverter; ComponentLink2Description: https://datasheet.octopart.com:443/RC0805FR-07130KL-Yageo-datasheet-103092701.pdf?src-supplier=Upverter; ComponentLink3URL: https://datasheet.octopart.com:443/RC0805FR-07130KL-Yageo-Group-datasheet-190305687.pdf?src-supplier=Future+Electronics; ComponentLink3Description: https://datasheet.octopart.com:443/RC0805FR-07130KL-Yageo-Group-datasheet-190305687.pdf?src-supplier=Future+Electronics; ComponentLink4URL: https://datasheet.octopart.com:443/RC0805FR-07130KL-Yageo-datasheet-164759695.pdf?src-supplier=Future+Electronics; ComponentLink4Description: https://datasheet.octopart.com:443/RC0805FR-07130KL-Yageo-datasheet-164759695.pdf?src-supplier=Future+Electronics; ComponentLink5URL: https://datasheet.octopart.com:443/RC0805FR-07130KL-Yageo-datasheet-12592811.pdf?src-supplier=Future+Electronics; ComponentLink5Description: https://datasheet.octopart.com:443/RC0805FR-07130KL-Yageo-datasheet-12592811.pdf?src-supplier=Future+Electronics; ComponentLink6URL: https://datasheet.octopart.com:443/RC0805FR-07130KL-Yageo-datasheet-8324252.pdf?src-supplier=Future+Electronics; ComponentLink6Description: https://datasheet.octopart.com:443/RC0805FR-07130KL-Yageo-datasheet-8324252.pdf?src-supplier=Future+Electronics; ComponentLink7URL: https://datasheet.octopart.com:443/RC0805FR-07130KL-Yageo-datasheet-8330313.pdf?src-supplier=Burklin+Elektronik; ComponentLink7Description: https://datasheet.octopart.com:443/RC0805FR-07130KL-Yageo-datasheet-8330313.pdf?src-supplier=Burklin+Elektronik; ComponentLink8URL: https://datasheet.octopart.com:443/RC0805FR-07130KL-Yageo-Group-datasheet-189192902.pdf?src-supplier=LCSC; ComponentLink8Description: https://datasheet.octopart.com:443/RC0805FR-07130KL-Yageo-Group-datasheet-189192902.pdf?src-supplier=LCSC; ComponentLink9URL: https://datasheet.octopart.com:443/RC0805FR-07130KL-Yageo-datasheet-148775077.pdf?src-supplier=TME; ComponentLink9Description: https://datasheet.octopart.com:443/RC0805FR-07130KL-Yageo-datasheet-148775077.pdf?src-supplier=TME; ComponentLink10URL: https://datasheet.octopart.com/RC0805FR-07130KL-Yageo-datasheet-73766026.pdf; ComponentLink10Description: https://datasheet.octopart.com/RC0805FR-07130KL-Yageo-datasheet-73766026.pdf; ComponentLink11URL: https://datasheet.octopart.com:443/RC0805FR-07130KL-Yageo-datasheet-118657.pdf?src-supplier=DigiKey; ComponentLink11Description: https://datasheet.octopart.com:443/RC0805FR-07130KL-Yageo-datasheet-118657.pdf?src-supplier=DigiKey; ComponentLink12URL: http://sigma.octopart.com:80/conflict_mineral_statement/Yageo-company-3.pdf?src-supplier=Compliance+Statements; ComponentLink12Description: http://sigma.octopart.com:80/conflict_mineral_statement/Yageo-company-3.pdf?src-supplier=Compliance+Statements; ComponentLink13URL: http://sigma.octopart.com:80/rohs_statement/Yageo-company-2.pdf?src-supplier=Compliance+Statements; ComponentLink13Description: http://sigma.octopart.com:80/rohs_statement/Yageo-company-2.pdf?src-supplier=Compliance+Statements; Supplier Part Number 1: 311-130KCRDKR-ND; LINK: https://linhkien.cxtvn.com/6167-dien-tro-130k-0805-1-100c.html
R18 = RES_SMD 270K OHM 5% 1/8W 0805: Res Thick Film 0805 270K Ohm 5% 0.125W(1/8W) ±100ppm/C Pad SMD T/R; Manufacturer: Yageo Group; Manufacturer Part Number: RC0805JR-07270KL; Manufacturer Package Identifier: 0805 (2012 metric); Max Power Dissipation: 125mW; Resistance: 270kΩ; Temperature Coefficient: 100ppm/°C; Voltage Rating: 150V; LIB MADE BY: MR HOANG; Supplier 1: DigiKey; RoHS: Compliant; Category: Chip SMD Resistors; Stock 1: 25000; Pricing 1: 5000=0.00636, 10000=0.00567, 15000=0.00534, 25000=0.00497, 35000=0.00477, 50000=0.00457 (USD); Case/Package: 0805; Case Code (Imperial): 0805; China RoHS: Non-Compliant; Composition: Thick Film; Contact Plating: Lead, Tin; Country of Origin: Mainland China, Taiwan; Depth: 1.25mm; Export Control Classification Number (ECCN) Code: EAR99; Features: Moisture Resistant; Height: 500µm; Harmonized Tariff Schedule (HTS) Code: 8533.21.00.30; Introduction Date: 2004-09-22; Lead Free: Lead Free; Length: 2mm; Lifecycle Status: Production; Max Operating Temperature: 155°C; Military Standard: Not; Min Operating Temperature: -55°C; Mount: Surface Mount; Number of Pins: 2; Number of Terminals: 2; Number of Terminations: 2; Power Rating: 125mW; Radiation Hardening: No; REACH SVHC: Unaffected; Schedule B: 8533210045, 8533210045|8533210045|8533210045|8533210045|8533210045; Termination: SMD/SMT; Tolerance: 5%; Voltage Rating (AC): 150V; Voltage Rating (DC): 150V; Weight: 5.499807mg; Width: 1.25mm; Working Voltage: 150V; ComponentLink1URL: https://datasheet.octopart.com:443/RC0805JR-07270KL-Yageo-datasheet-175887523.pdf?src-supplier=IHS; ComponentLink1Description: https://datasheet.octopart.com:443/RC0805JR-07270KL-Yageo-datasheet-175887523.pdf?src-supplier=IHS; ComponentLink2URL: https://datasheet.octopart.com:443/RC0805JR-07270KL-Yageo-datasheet-8330313.pdf?src-supplier=Newark; ComponentLink2Description: https://datasheet.octopart.com:443/RC0805JR-07270KL-Yageo-datasheet-8330313.pdf?src-supplier=Newark; ComponentLink3URL: https://datasheet.octopart.com:443/RC0805JR-07270KL-Yageo-datasheet-62067350.pdf?src-supplier=Farnell; ComponentLink3Description: https://datasheet.octopart.com:443/RC0805JR-07270KL-Yageo-datasheet-62067350.pdf?src-supplier=Farnell; ComponentLink4URL: https://datasheet.octopart.com:443/RC0805JR-07270KL-Yageo-Group-datasheet-176638170.pdf?src-supplier=Future+Electronics; ComponentLink4Description: https://datasheet.octopart.com:443/RC0805JR-07270KL-Yageo-Group-datasheet-176638170.pdf?src-supplier=Future+Electronics; ComponentLink5URL: https://datasheet.octopart.com:443/RC0805JR-07270KL-Yageo-datasheet-164759695.pdf?src-supplier=Future+Electronics; ComponentLink5Description: https://datasheet.octopart.com:443/RC0805JR-07270KL-Yageo-datasheet-164759695.pdf?src-supplier=Future+Electronics; ComponentLink6URL: https://datasheet.octopart.com:443/RC0805JR-07270KL-Yageo-datasheet-12592811.pdf?src-supplier=Future+Electronics; ComponentLink6Description: https://datasheet.octopart.com:443/RC0805JR-07270KL-Yageo-datasheet-12592811.pdf?src-supplier=Future+Electronics; ComponentLink7URL: https://datasheet.octopart.com:443/RC0805JR-07270KL-Yageo-datasheet-8324252.pdf?src-supplier=Future+Electronics; ComponentLink7Description: https://datasheet.octopart.com:443/RC0805JR-07270KL-Yageo-datasheet-8324252.pdf?src-supplier=Future+Electronics; ComponentLink8URL: https://datasheet.octopart.com/RC0805JR-07270KL-Yageo-datasheet-73766026.pdf; ComponentLink8Description: https://datasheet.octopart.com/RC0805JR-07270KL-Yageo-datasheet-73766026.pdf; ComponentLink9URL: https://datasheet.octopart.com:443/RC0805JR-07270KL-Yageo---Phycomp-datasheet-8327506.pdf?src-supplier=element14+APAC; ComponentLink9Description: https://datasheet.octopart.com:443/RC0805JR-07270KL-Yageo---Phycomp-datasheet-8327506.pdf?src-supplier=element14+APAC; ComponentLink10URL: https://datasheet.octopart.com:443/RC0805JR-07270KL-Yageo-datasheet-118657.pdf?src-supplier=DigiKey; ComponentLink10Description: https://datasheet.octopart.com:443/RC0805JR-07270KL-Yageo-datasheet-118657.pdf?src-supplier=DigiKey; ComponentLink11URL: http://sigma.octopart.com:80/conflict_mineral_statement/Yageo-company-3.pdf?src-supplier=Compliance+Statements; ComponentLink11Description: http://sigma.octopart.com:80/conflict_mineral_statement/Yageo-company-3.pdf?src-supplier=Compliance+Statements; ComponentLink12URL: http://sigma.octopart.com:80/rohs_statement/Yageo-company-2.pdf?src-supplier=Compliance+Statements; ComponentLink12Description: http://sigma.octopart.com:80/rohs_statement/Yageo-company-2.pdf?src-supplier=Compliance+Statements; Supplier Part Number 1: 311-270KARTR-ND; LINK: https://linhkien.cxtvn.com/2220-dien-tro-270k-0805-5-100c.html
R19 = RES_SMD 20K OHM 1% 1/8W 0805: Res Thick Film 0805 20K Ohm 1% 1/8W ±100ppm/°C Molded SMD Punched Carrier T/R; Manufacturer: Panasonic; Manufacturer Part Number: ERJ6ENF2002V; Manufacturer Lifecycle Status: ACTIVE; Part Series: Precision Thick Film Chip Resistors; Max Power Dissipation: 125mW; Resistance: 20kΩ; Voltage Rating: 150V; LIB MADE BY: MR HOANG; Supplier 1: DigiKey; RoHS: Compliant; Category: Chip SMD Resistors; Stock 1: 549812; Pricing 1: 5000=0.01444, 10000=0.01325, 15000=0.01267, 25000=0.01204, 35000=0.01169, 50000=0.01135 (USD); Case/Package: 0805; Case Code (Imperial): 0805; China RoHS: Non-Compliant; Composition: Thick Film; Contact Plating: Tin; Country of Origin: Japan, Mainland China; Depth: 1.25mm; Export Control Classification Number (ECCN) Code: EAR99; Features: Automotive AEC-Q200; Height: 600µm; Harmonized Tariff Schedule (HTS) Code: 8533.21.00.30; Introduction Date: 1998-02-25; Lead Free: Lead Free; Length: 2mm; Lifecycle Status: Production; Max Operating Temperature: 155°C; Military Standard: Not; Min Operating Temperature: -55°C; Mount: Surface Mount; Number of Pins: 2; Number of Terminals: 2; Number of Terminations: 2; Packaging: Cut Tape; Power Rating: 125mW; Radiation Hardening: No; Ratings: AEC-Q200; REACH SVHC: Yes; Schedule B: 8533210045, 8533210045|8533210045|8533210045|8533210045|8533210045; Temperature Coefficient: 100ppm/°C; Termination: SMD/SMT; Tolerance: 1%; Voltage Rating (DC): 150V; Width: 1.25mm; Working Voltage: 150V; ComponentLink1URL: https://sigma.octopart.com:443/138766958/technical_drawing/Panasonic-ERJ-6ENF2002V.pdf?src-supplier=Upverter; ComponentLink1Description: https://sigma.octopart.com:443/138766958/technical_drawing/Panasonic-ERJ-6ENF2002V.pdf?src-supplier=Upverter; ComponentLink2URL: https://datasheet.octopart.com:443/ERJ6ENF2002V-Panasonic-datasheet-82288794.pdf?src-supplier=Upverter; ComponentLink2Description: https://datasheet.octopart.com:443/ERJ6ENF2002V-Panasonic-datasheet-82288794.pdf?src-supplier=Upverter; ComponentLink3URL: https://datasheet.octopart.com:443/ERJ6ENF2002V-Panasonic-datasheet-13266541.pdf?src-supplier=RS+(Formerly+Allied+Electronics); ComponentLink3Description: https://datasheet.octopart.com:443/ERJ6ENF2002V-Panasonic-datasheet-13266541.pdf?src-supplier=RS+(Formerly+Allied+Electronics); ComponentLink4URL: https://datasheet.octopart.com:443/ERJ6ENF2002V-Panasonic-datasheet-10025800.pdf?src-supplier=Future+Electronics; ComponentLink4Description: https://datasheet.octopart.com:443/ERJ6ENF2002V-Panasonic-datasheet-10025800.pdf?src-supplier=Future+Electronics; ComponentLink5URL: https://datasheet.octopart.com:443/ERJ6ENF2002V-Panasonic-datasheet-8853621.pdf?src-supplier=Future+Electronics; ComponentLink5Description: https://datasheet.octopart.com:443/ERJ6ENF2002V-Panasonic-datasheet-8853621.pdf?src-supplier=Future+Electronics; ComponentLink6URL: https://datasheet.octopart.com:443/ERJ6ENF2002V-Panasonic-datasheet-5313456.pdf?src-supplier=Future+Electronics; ComponentLink6Description: https://datasheet.octopart.com:443/ERJ6ENF2002V-Panasonic-datasheet-5313456.pdf?src-supplier=Future+Electronics; ComponentLink7URL: https://datasheet.octopart.com:443/ERJ6ENF2002V-Panasonic-datasheet-48891056.pdf?src-supplier=Newark; ComponentLink7Description: https://datasheet.octopart.com:443/ERJ6ENF2002V-Panasonic-datasheet-48891056.pdf?src-supplier=Newark; ComponentLink8URL: https://datasheet.octopart.com:443/ERJ6ENF2002V-Panasonic-datasheet-136608610.pdf?src-supplier=Newark; ComponentLink8Description: https://datasheet.octopart.com:443/ERJ6ENF2002V-Panasonic-datasheet-136608610.pdf?src-supplier=Newark; ComponentLink9URL: https://datasheet.octopart.com:443/ERJ-6ENF2002V-Panasonic-datasheet-154766169.pdf?src-supplier=JRH+Electronics; ComponentLink9Description: https://datasheet.octopart.com:443/ERJ-6ENF2002V-Panasonic-datasheet-154766169.pdf?src-supplier=JRH+Electronics; ComponentLink10URL: https://datasheet.octopart.com:443/ERJ6ENF2002V-Panasonic-datasheet-138819429.pdf?src-supplier=Burklin+Elektronik; ComponentLink10Description: https://datasheet.octopart.com:443/ERJ6ENF2002V-Panasonic-datasheet-138819429.pdf?src-supplier=Burklin+Elektronik; ComponentLink11URL: https://datasheet.octopart.com/ERJ6ENF2002V-Panasonic-datasheet-78375410.pdf; ComponentLink11Description: https://datasheet.octopart.com/ERJ6ENF2002V-Panasonic-datasheet-78375410.pdf; ComponentLink12URL: https://datasheet.octopart.com/Precision-Thick-Film-Chip-Resistors-Panasonic-datasheet-family-106.pdf; ComponentLink12Description: https://datasheet.octopart.com/Precision-Thick-Film-Chip-Resistors-Panasonic-datasheet-family-106.pdf; ComponentLink13URL: https://datasheet.octopart.com:443/ERJ-6ENF2002V-Panasonic---ECG-datasheet-15994758.pdf?src-supplier=Farnell; ComponentLink13Description: https://datasheet.octopart.com:443/ERJ-6ENF2002V-Panasonic---ECG-datasheet-15994758.pdf?src-supplier=Farnell; ComponentLink14URL: https://datasheet.octopart.com:443/ERJ-6ENF2002V-Panasonic-datasheet-7538305.pdf?src-supplier=Jameco+(USA); ComponentLink14Description: https://datasheet.octopart.com:443/ERJ-6ENF2002V-Panasonic-datasheet-7538305.pdf?src-supplier=Jameco+(USA); ComponentLink15URL: https://datasheet.octopart.com:443/ERJ-6ENF2002V-Panasonic-datasheet-118621.pdf?src-supplier=DigiKey; ComponentLink15Description: https://datasheet.octopart.com:443/ERJ-6ENF2002V-Panasonic-datasheet-118621.pdf?src-supplier=DigiKey; ComponentLink16URL: https://datasheet.octopart.com:443/ERJ-6ENF2002V-Panasonic-datasheet-41391857.pdf?src-supplier=Electro+Sonic; ComponentLink16Description: https://datasheet.octopart.com:443/ERJ-6ENF2002V-Panasonic-datasheet-41391857.pdf?src-supplier=Electro+Sonic; Supplier Part Number 1: P20.0KCTR-ND; LINK: https://linhkien.cxtvn.com/2440-dien-tro-20k-0805-1-100c.html